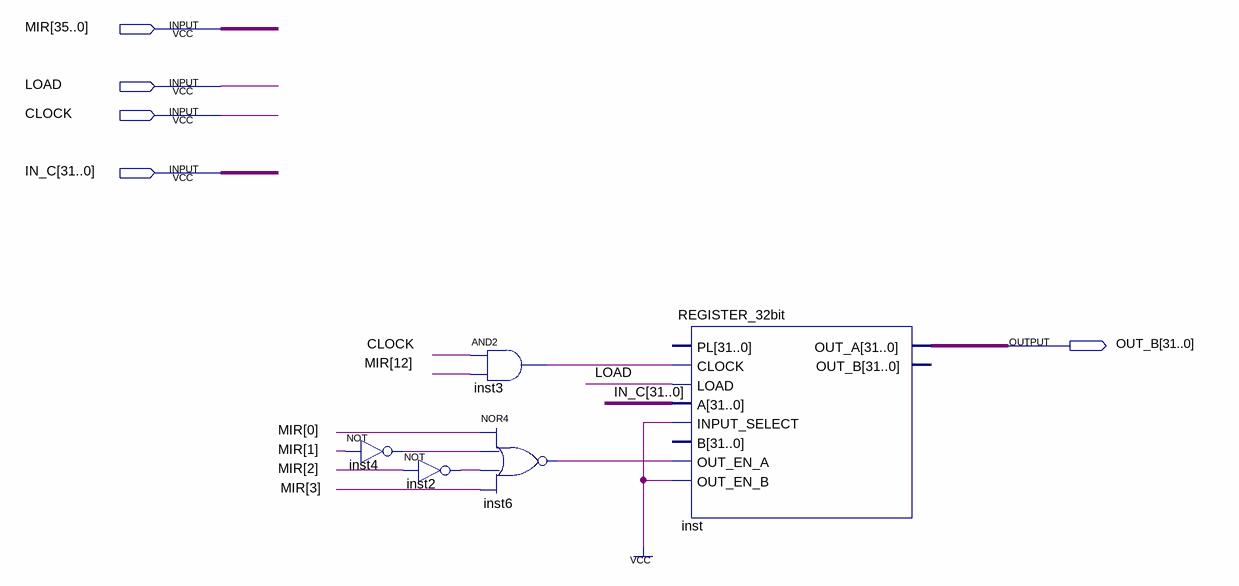
[diagram p0: schematic sheet]
// Quartus schematic CPP.bdf as structural Verilog: 5 symbols, 5 pins
module CPP (
  input  [35:0] MIR,
  input  LOAD,
  input  CLOCK,
  input  [31:0] IN_C,
  output [31:0] OUT_B
);

  wire inst2_out, inst3_out, inst4_out, inst6_out;

  not inst4 (inst4_out, MIR[1]);
  not inst2 (inst2_out, MIR[2]);
  and inst3 (inst3_out, CLOCK, MIR[12]);
  nor inst6 (inst6_out, MIR[0], inst4_out, inst2_out, MIR[3]);
  REGISTER_32bit inst (
    .CLOCK(inst3_out), .LOAD(LOAD), .A(IN_C), .INPUT_SELECT(1'b1), .OUT_EN_A(inst6_out), .OUT_EN_B(1'b1),
    .OUT_A(OUT_B));  // open: PL, B, OUT_B
endmodule
